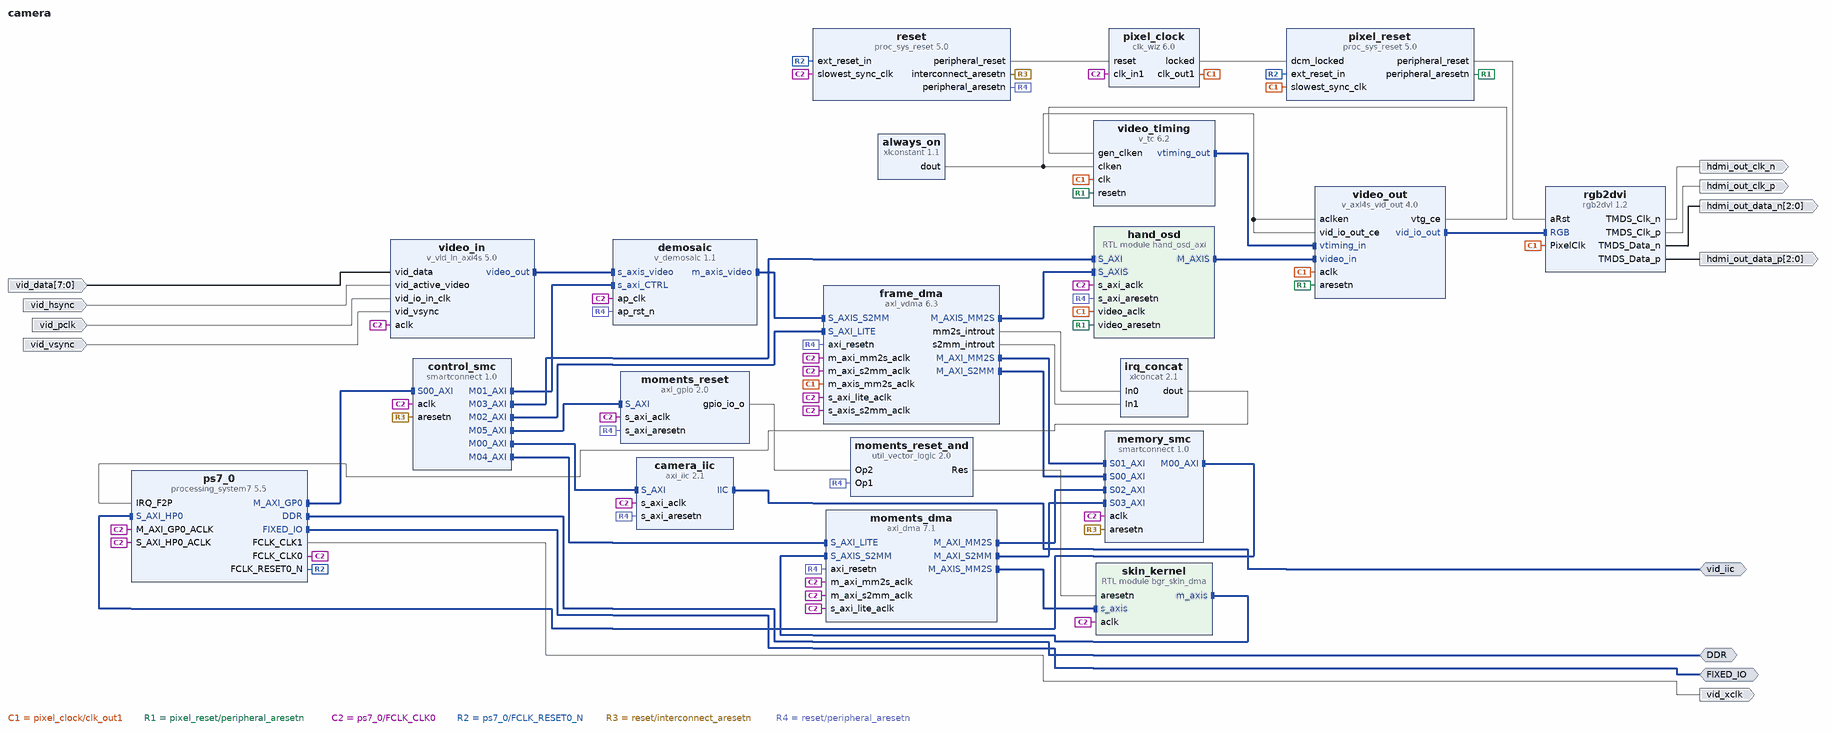
[diagram p0: block diagram of the top level]
# Vivado block design camera, xc7z020clg400-1, Vivado 2026.1
create_bd_design camera

create_bd_intf_port -mode Master -vlnv xilinx.com:interface:ddrx_rtl:1.0 DDR
create_bd_intf_port -mode Master -vlnv xilinx.com:display_processing_system7:fixedio_rtl:1.0 FIXED_IO
create_bd_intf_port -mode Master -vlnv xilinx.com:interface:iic_rtl:1.0 vid_iic
create_bd_port -dir O hdmi_out_clk_p
create_bd_port -dir O hdmi_out_clk_n
create_bd_port -dir O -from 2 -to 0 hdmi_out_data_p
create_bd_port -dir O -from 2 -to 0 hdmi_out_data_n
create_bd_port -dir O vid_xclk
create_bd_port -dir I vid_pclk
create_bd_port -dir I vid_vsync
create_bd_port -dir I vid_hsync
create_bd_port -dir I -from 7 -to 0 vid_data

create_bd_cell -type ip -vlnv xilinx.com:ip:processing_system7:5.5 ps7_0
set_property -dict [list \
  CONFIG.PCW_APU_PERIPHERAL_FREQMHZ 650 \
  CONFIG.PCW_CRYSTAL_PERIPHERAL_FREQMHZ 50 \
  CONFIG.PCW_ENET0_ENET0_IO {MIO 16 .. 27} \
  CONFIG.PCW_ENET0_GRP_MDIO_ENABLE 1 \
  CONFIG.PCW_ENET0_GRP_MDIO_IO {MIO 52 .. 53} \
  CONFIG.PCW_ENET0_PERIPHERAL_ENABLE 1 \
  CONFIG.PCW_EN_CLK1_PORT 1 \
  CONFIG.PCW_EN_CLK2_PORT 1 \
  CONFIG.PCW_EN_CLK3_PORT 1 \
  CONFIG.PCW_FCLK_CLK1_BUF TRUE \
  CONFIG.PCW_FCLK_CLK2_BUF TRUE \
  CONFIG.PCW_FCLK_CLK3_BUF TRUE \
  CONFIG.PCW_FPGA0_PERIPHERAL_FREQMHZ 100 \
  CONFIG.PCW_FPGA1_PERIPHERAL_FREQMHZ 24.000000 \
  CONFIG.PCW_FPGA2_PERIPHERAL_FREQMHZ 200 \
  CONFIG.PCW_FPGA3_PERIPHERAL_FREQMHZ 100 \
  CONFIG.PCW_FPGA_FCLK1_ENABLE 1 \
  CONFIG.PCW_FPGA_FCLK2_ENABLE 1 \
  CONFIG.PCW_FPGA_FCLK3_ENABLE 1 \
  CONFIG.PCW_GPIO_EMIO_GPIO_ENABLE 1 \
  CONFIG.PCW_GPIO_EMIO_GPIO_IO 10 \
  CONFIG.PCW_GPIO_EMIO_GPIO_WIDTH 10 \
  CONFIG.PCW_GPIO_MIO_GPIO_ENABLE 0 \
  CONFIG.PCW_I2C0_GRP_INT_ENABLE 1 \
  CONFIG.PCW_I2C0_GRP_INT_IO EMIO \
  CONFIG.PCW_I2C0_I2C0_IO {MIO 50 .. 51} \
  CONFIG.PCW_I2C0_PERIPHERAL_ENABLE 1 \
  CONFIG.PCW_I2C1_I2C1_IO EMIO \
  CONFIG.PCW_I2C1_PERIPHERAL_ENABLE 1 \
  CONFIG.PCW_I2C_PERIPHERAL_FREQMHZ 108.333336 \
  CONFIG.PCW_IRQ_F2P_INTR 1 \
  CONFIG.PCW_PERIPHERAL_BOARD_PRESET None \
  CONFIG.PCW_PRESET_BANK1_VOLTAGE {LVCMOS 1.8V} \
  CONFIG.PCW_QSPI_GRP_FBCLK_ENABLE 1 \
  CONFIG.PCW_QSPI_GRP_FBCLK_IO {MIO 8} \
  CONFIG.PCW_QSPI_GRP_SINGLE_SS_ENABLE 1 \
  CONFIG.PCW_QSPI_GRP_SINGLE_SS_IO {MIO 1 .. 6} \
  CONFIG.PCW_QSPI_PERIPHERAL_ENABLE 1 \
  CONFIG.PCW_QSPI_QSPI_IO {MIO 1 .. 6} \
  CONFIG.PCW_SD0_GRP_CD_ENABLE 1 \
  CONFIG.PCW_SD0_GRP_CD_IO {MIO 47} \
  CONFIG.PCW_SD0_GRP_WP_ENABLE 0 \
  CONFIG.PCW_SD0_PERIPHERAL_ENABLE 1 \
  CONFIG.PCW_SD0_SD0_IO {MIO 40 .. 45} \
  CONFIG.PCW_SDIO_PERIPHERAL_FREQMHZ 50 \
  CONFIG.PCW_SINGLE_QSPI_DATA_MODE x4 \
  CONFIG.PCW_UART0_PERIPHERAL_ENABLE 1 \
  CONFIG.PCW_UART0_UART0_IO {MIO 14 .. 15} \
  CONFIG.PCW_UART1_PERIPHERAL_ENABLE 0 \
  CONFIG.PCW_UART_PERIPHERAL_FREQMHZ 100 \
  CONFIG.PCW_UIPARAM_DDR_BUS_WIDTH {16 Bit} \
  CONFIG.PCW_UIPARAM_DDR_FREQ_MHZ 525 \
  CONFIG.PCW_UIPARAM_DDR_PARTNO Custom \
  CONFIG.PCW_USB0_PERIPHERAL_ENABLE 1 \
  CONFIG.PCW_USB0_USB0_IO {MIO 28 .. 39} \
  CONFIG.PCW_USE_FABRIC_INTERRUPT 1 \
  CONFIG.PCW_USE_S_AXI_HP0 1 \
] [get_bd_cells ps7_0]
# 481 more settings of ps7_0 are not shown: defaults, MIO pin electricals, DDR timing, and values the tool derives
create_bd_cell -type ip -vlnv xilinx.com:ip:smartconnect:1.0 control_smc
set_property -dict {CONFIG.NUM_MI 6} [get_bd_cells control_smc]
create_bd_cell -type ip -vlnv xilinx.com:ip:smartconnect:1.0 memory_smc
set_property -dict {CONFIG.NUM_SI 4} [get_bd_cells memory_smc]
create_bd_cell -type ip -vlnv xilinx.com:ip:axi_iic:2.1 camera_iic
create_bd_cell -type ip -vlnv xilinx.com:ip:v_vid_in_axi4s:5.0 video_in
set_property -dict {CONFIG.C_HAS_ASYNC_CLK 1 CONFIG.C_M_AXIS_VIDEO_FORMAT 12} [get_bd_cells video_in]
create_bd_cell -type ip -vlnv xilinx.com:ip:v_demosaic:1.1 demosaic
create_bd_cell -type ip -vlnv xilinx.com:ip:axi_vdma:6.3 frame_dma
set_property -dict [list \
  CONFIG.c_enable_mm2s_buf_empty 1 \
  CONFIG.c_include_mm2s 1 \
  CONFIG.c_include_s2mm 1 \
  CONFIG.c_m_axis_mm2s_tdata_width 24 \
] [get_bd_cells frame_dma]
create_bd_cell -type ip -vlnv xilinx.com:ip:proc_sys_reset:5.0 reset
create_bd_cell -type ip -vlnv xilinx.com:ip:xlconcat:2.1 irq_concat
set_property -dict {CONFIG.NUM_PORTS 2} [get_bd_cells irq_concat]
create_bd_cell -type ip -vlnv xilinx.com:ip:clk_wiz:6.0 pixel_clock
set_property -dict [list \
  CONFIG.CLKOUT1_REQUESTED_OUT_FREQ 74.250 \
  CONFIG.PRIM_IN_FREQ 100.000 \
  CONFIG.PRIM_SOURCE Global_buffer \
  CONFIG.RESET_TYPE ACTIVE_HIGH \
  CONFIG.USE_LOCKED true \
  CONFIG.USE_RESET true \
] [get_bd_cells pixel_clock]
create_bd_cell -type ip -vlnv xilinx.com:ip:proc_sys_reset:5.0 pixel_reset
create_bd_cell -type ip -vlnv xilinx.com:ip:v_tc:6.2 video_timing
set_property -dict {CONFIG.HAS_AXI4_LITE false CONFIG.VIDEO_MODE 720p CONFIG.enable_detection false} [get_bd_cells video_timing]
create_bd_cell -type ip -vlnv xilinx.com:ip:v_axi4s_vid_out:4.0 video_out
create_bd_cell -type ip -vlnv digilentinc.com:ip:rgb2dvi:1.2 rgb2dvi
set_property -dict [list \
  CONFIG.kClkPrimitive MMCM \
  CONFIG.kClkRange 2 \
  CONFIG.kGenerateSerialClk true \
  CONFIG.kRstActiveHigh true \
] [get_bd_cells rgb2dvi]
create_bd_cell -type ip -vlnv xilinx.com:ip:xlconstant:1.1 always_on
set_property -dict {CONFIG.CONST_VAL 1} [get_bd_cells always_on]
create_bd_cell -type module -reference hand_osd_axi hand_osd
create_bd_cell -type ip -vlnv xilinx.com:ip:axi_dma:7.1 moments_dma
set_property -dict [list \
  CONFIG.c_include_mm2s_dre 0 \
  CONFIG.c_include_s2mm_dre 0 \
  CONFIG.c_include_sg 0 \
  CONFIG.c_m_axi_mm2s_data_width 64 \
  CONFIG.c_m_axi_s2mm_data_width 64 \
  CONFIG.c_m_axis_mm2s_tdata_width 32 \
  CONFIG.c_s_axis_s2mm_tdata_width 32 \
  CONFIG.c_sg_length_width 23 \
] [get_bd_cells moments_dma]
create_bd_cell -type ip -vlnv xilinx.com:ip:axi_gpio:2.0 moments_reset
set_property -dict {CONFIG.C_ALL_OUTPUTS 1 CONFIG.C_DOUT_DEFAULT 0x00000001 CONFIG.C_GPIO_WIDTH 1} [get_bd_cells moments_reset]
create_bd_cell -type ip -vlnv xilinx.com:ip:util_vector_logic:2.0 moments_reset_and
set_property -dict {CONFIG.C_OPERATION and CONFIG.C_SIZE 1} [get_bd_cells moments_reset_and]
create_bd_cell -type module -reference bgr_skin_dma skin_kernel

# ---- connections ----

connect_bd_intf_net [get_bd_intf_pins camera_iic/IIC] [get_bd_intf_ports vid_iic]
connect_bd_intf_net [get_bd_intf_pins control_smc/M00_AXI] [get_bd_intf_pins camera_iic/S_AXI]
connect_bd_intf_net [get_bd_intf_pins control_smc/M01_AXI] [get_bd_intf_pins demosaic/s_axi_CTRL]
connect_bd_intf_net [get_bd_intf_pins control_smc/M02_AXI] [get_bd_intf_pins frame_dma/S_AXI_LITE]
connect_bd_intf_net [get_bd_intf_pins control_smc/M03_AXI] [get_bd_intf_pins hand_osd/S_AXI]
connect_bd_intf_net [get_bd_intf_pins control_smc/M04_AXI] [get_bd_intf_pins moments_dma/S_AXI_LITE]
connect_bd_intf_net [get_bd_intf_pins control_smc/M05_AXI] [get_bd_intf_pins moments_reset/S_AXI]
connect_bd_intf_net [get_bd_intf_pins demosaic/m_axis_video] [get_bd_intf_pins frame_dma/S_AXIS_S2MM]
connect_bd_intf_net [get_bd_intf_pins frame_dma/M_AXIS_MM2S] [get_bd_intf_pins hand_osd/S_AXIS]
connect_bd_intf_net [get_bd_intf_pins frame_dma/M_AXI_MM2S] [get_bd_intf_pins memory_smc/S01_AXI]
connect_bd_intf_net [get_bd_intf_pins frame_dma/M_AXI_S2MM] [get_bd_intf_pins memory_smc/S00_AXI]
connect_bd_intf_net [get_bd_intf_pins hand_osd/M_AXIS] [get_bd_intf_pins video_out/video_in]
connect_bd_intf_net [get_bd_intf_pins memory_smc/M00_AXI] [get_bd_intf_pins ps7_0/S_AXI_HP0]
connect_bd_intf_net [get_bd_intf_pins moments_dma/M_AXIS_MM2S] [get_bd_intf_pins skin_kernel/s_axis]
connect_bd_intf_net [get_bd_intf_pins moments_dma/M_AXI_MM2S] [get_bd_intf_pins memory_smc/S02_AXI]
connect_bd_intf_net [get_bd_intf_pins moments_dma/M_AXI_S2MM] [get_bd_intf_pins memory_smc/S03_AXI]
connect_bd_intf_net -intf_net moments_kernel_m_axis [get_bd_intf_pins skin_kernel/m_axis] [get_bd_intf_pins moments_dma/S_AXIS_S2MM]
connect_bd_intf_net [get_bd_intf_pins ps7_0/DDR] [get_bd_intf_ports DDR]
connect_bd_intf_net [get_bd_intf_pins ps7_0/FIXED_IO] [get_bd_intf_ports FIXED_IO]
connect_bd_intf_net [get_bd_intf_pins ps7_0/M_AXI_GP0] [get_bd_intf_pins control_smc/S00_AXI]
connect_bd_intf_net [get_bd_intf_pins video_in/video_out] [get_bd_intf_pins demosaic/s_axis_video]
connect_bd_intf_net [get_bd_intf_pins video_out/vid_io_out] [get_bd_intf_pins rgb2dvi/RGB]
connect_bd_intf_net [get_bd_intf_pins video_timing/vtiming_out] [get_bd_intf_pins video_out/vtiming_in]
connect_bd_net [get_bd_pins always_on/dout] [get_bd_pins video_out/aclken] [get_bd_pins video_out/vid_io_out_ce] [get_bd_pins video_timing/clken]
connect_bd_net [get_bd_pins frame_dma/mm2s_introut] [get_bd_pins irq_concat/In0]
connect_bd_net [get_bd_pins frame_dma/s2mm_introut] [get_bd_pins irq_concat/In1]
connect_bd_net [get_bd_pins irq_concat/dout] [get_bd_pins ps7_0/IRQ_F2P]
connect_bd_net [get_bd_pins moments_reset_and/Res] [get_bd_pins skin_kernel/aresetn]
connect_bd_net [get_bd_pins moments_reset/gpio_io_o] [get_bd_pins moments_reset_and/Op2]
connect_bd_net [get_bd_pins pixel_clock/clk_out1] \
  [get_bd_pins pixel_reset/slowest_sync_clk] [get_bd_pins frame_dma/m_axis_mm2s_aclk] [get_bd_pins video_out/aclk] \
  [get_bd_pins video_timing/clk] [get_bd_pins rgb2dvi/PixelClk] [get_bd_pins hand_osd/video_aclk]
connect_bd_net [get_bd_pins pixel_clock/locked] [get_bd_pins pixel_reset/dcm_locked]
connect_bd_net [get_bd_pins pixel_reset/peripheral_aresetn] \
  [get_bd_pins video_out/aresetn] [get_bd_pins video_timing/resetn] [get_bd_pins hand_osd/video_aresetn]
connect_bd_net [get_bd_pins pixel_reset/peripheral_reset] [get_bd_pins rgb2dvi/aRst]
connect_bd_net [get_bd_pins ps7_0/FCLK_CLK0] \
  [get_bd_pins ps7_0/M_AXI_GP0_ACLK] [get_bd_pins ps7_0/S_AXI_HP0_ACLK] [get_bd_pins control_smc/aclk] \
  [get_bd_pins memory_smc/aclk] [get_bd_pins camera_iic/s_axi_aclk] [get_bd_pins video_in/aclk] [get_bd_pins demosaic/ap_clk] \
  [get_bd_pins frame_dma/s_axis_s2mm_aclk] [get_bd_pins frame_dma/m_axi_s2mm_aclk] [get_bd_pins frame_dma/s_axi_lite_aclk] \
  [get_bd_pins reset/slowest_sync_clk] [get_bd_pins frame_dma/m_axi_mm2s_aclk] [get_bd_pins pixel_clock/clk_in1] \
  [get_bd_pins moments_dma/s_axi_lite_aclk] [get_bd_pins moments_dma/m_axi_mm2s_aclk] \
  [get_bd_pins moments_dma/m_axi_s2mm_aclk] [get_bd_pins moments_reset/s_axi_aclk] [get_bd_pins hand_osd/s_axi_aclk] \
  [get_bd_pins skin_kernel/aclk]
connect_bd_net [get_bd_pins ps7_0/FCLK_CLK1] [get_bd_ports vid_xclk]
connect_bd_net [get_bd_pins ps7_0/FCLK_RESET0_N] [get_bd_pins pixel_reset/ext_reset_in] [get_bd_pins reset/ext_reset_in]
connect_bd_net [get_bd_pins reset/interconnect_aresetn] [get_bd_pins control_smc/aresetn] [get_bd_pins memory_smc/aresetn]
connect_bd_net [get_bd_pins reset/peripheral_aresetn] \
  [get_bd_pins camera_iic/s_axi_aresetn] [get_bd_pins demosaic/ap_rst_n] [get_bd_pins frame_dma/axi_resetn] \
  [get_bd_pins moments_dma/axi_resetn] [get_bd_pins moments_reset/s_axi_aresetn] [get_bd_pins moments_reset_and/Op1] \
  [get_bd_pins hand_osd/s_axi_aresetn]
connect_bd_net [get_bd_pins reset/peripheral_reset] [get_bd_pins pixel_clock/reset]
connect_bd_net [get_bd_pins rgb2dvi/TMDS_Clk_n] [get_bd_ports hdmi_out_clk_n]
connect_bd_net [get_bd_pins rgb2dvi/TMDS_Clk_p] [get_bd_ports hdmi_out_clk_p]
connect_bd_net [get_bd_pins rgb2dvi/TMDS_Data_n] [get_bd_ports hdmi_out_data_n]
connect_bd_net [get_bd_pins rgb2dvi/TMDS_Data_p] [get_bd_ports hdmi_out_data_p]
connect_bd_net [get_bd_ports vid_data] [get_bd_pins video_in/vid_data]
connect_bd_net [get_bd_ports vid_hsync] [get_bd_pins video_in/vid_active_video]
connect_bd_net [get_bd_ports vid_pclk] [get_bd_pins video_in/vid_io_in_clk]
connect_bd_net [get_bd_ports vid_vsync] [get_bd_pins video_in/vid_vsync]
connect_bd_net [get_bd_pins video_out/vtg_ce] [get_bd_pins video_timing/gen_clken]

# ---- address map ----
assign_bd_address -offset 0x00000000 -range 512M -target_address_space [get_bd_addr_spaces frame_dma/Data_MM2S] [get_bd_addr_segs ps7_0/S_AXI_HP0/HP0_DDR_LOWOCM]
assign_bd_address -offset 0x00000000 -range 512M -target_address_space [get_bd_addr_spaces frame_dma/Data_S2MM] [get_bd_addr_segs ps7_0/S_AXI_HP0/HP0_DDR_LOWOCM]
assign_bd_address -offset 0x00000000 -range 512M -target_address_space [get_bd_addr_spaces moments_dma/Data_MM2S] [get_bd_addr_segs ps7_0/S_AXI_HP0/HP0_DDR_LOWOCM]
assign_bd_address -offset 0x00000000 -range 512M -target_address_space [get_bd_addr_spaces moments_dma/Data_S2MM] [get_bd_addr_segs ps7_0/S_AXI_HP0/HP0_DDR_LOWOCM]
assign_bd_address -offset 0x40400000 -range 64K -target_address_space [get_bd_addr_spaces ps7_0/Data] [get_bd_addr_segs moments_dma/S_AXI_LITE/Reg]
assign_bd_address -offset 0x41200000 -range 64K -target_address_space [get_bd_addr_spaces ps7_0/Data] [get_bd_addr_segs moments_reset/S_AXI/Reg]
assign_bd_address -offset 0x41600000 -range 64K -target_address_space [get_bd_addr_spaces ps7_0/Data] [get_bd_addr_segs camera_iic/S_AXI/Reg]
assign_bd_address -offset 0x43000000 -range 64K -target_address_space [get_bd_addr_spaces ps7_0/Data] [get_bd_addr_segs frame_dma/S_AXI_LITE/Reg]
assign_bd_address -offset 0x43C00000 -range 64K -target_address_space [get_bd_addr_spaces ps7_0/Data] [get_bd_addr_segs demosaic/s_axi_CTRL/Reg]
assign_bd_address -offset 0x43C10000 -range 128 -target_address_space [get_bd_addr_spaces ps7_0/Data] [get_bd_addr_segs hand_osd/S_AXI/reg0]

validate_bd_design
save_bd_design
